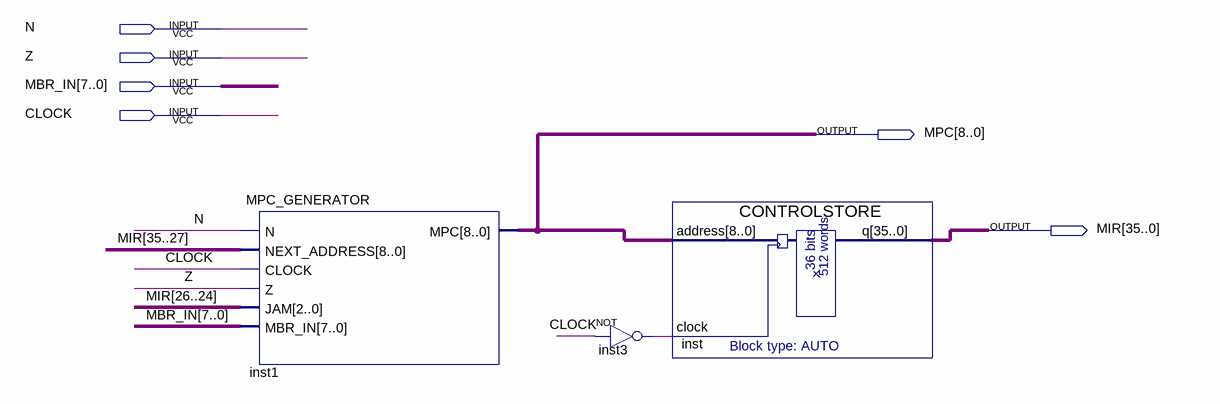
[diagram p0: schematic sheet]
// Quartus schematic CONTROL_UNIT.bdf as structural Verilog: 3 symbols, 6 pins
module CONTROL_UNIT (
  input  N,
  input  Z,
  input  [7:0] MBR_IN,
  input  CLOCK,
  output [8:0] MPC,
  output [35:0] MIR
);

  wire inst3_out;

  MPC_GENERATOR inst1 (
    .N(N), .NEXT_ADDRESS(MIR[35:27]), .CLOCK(CLOCK), .Z(Z), .JAM(MIR[26:24]), .MBR_IN(MBR_IN), .MPC(MPC));
  not inst3 (inst3_out, CLOCK);
  CONTROLSTORE inst (.address(MPC), .clock(inst3_out), .q(MIR));
endmodule
